# Altium project Library_Test.PrjPcb
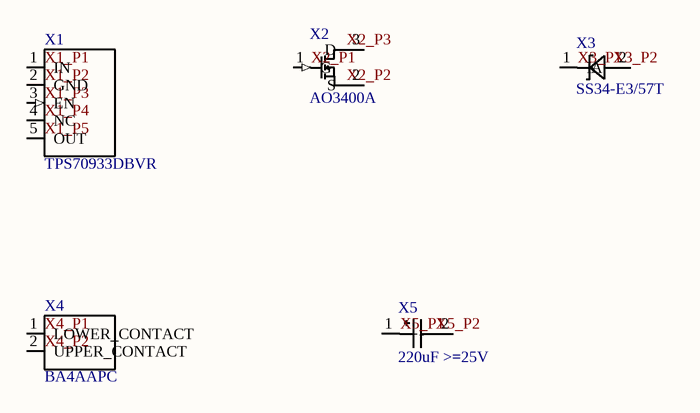
[diagram p0: Library_Test.SchDoc]
1 sheet, 5 parts. Net scope: global (net labels, ports and power ports of the same name join across sheets).

## Sheet Library_Test.SchDoc
size D

### Parts
X1  TPS70933DBVR  [TB_TPS709_DBV0005A]
X2  AO3400A  [TB_AOS_SOT23_PO00001M]
X3  SS34-E3/57T  [TB_VISHAY_SMC_SS34]
X4  BA4AAPC  [TB_MPD_BA4AAPC_REVH]
X5  220uF >=25V  [TB_CAP_RADIAL_D10_P5]

### Nets

Not connected (* = marked no-connect by the designer): X1 1(IN) 2(GND) 3(EN) 4(NC) 5(OUT); X2 1(G) 2(S) 3(D); X3 1(K) 2(A); X4 1(LOWER_CONTACT) 2(UPPER_CONTACT); X5 1(+) 2(-)

### Notes on the sheet
- Labels drawn without touching a wire or pin: X1_P1, X1_P2, X1_P3, X1_P4, X1_P5, X2_P1, X2_P2, X2_P3, X3_P1, X3_P2, X4_P1, X4_P2, X5_P1, X5_P2

### Library data of the parts
X1 = TPS70933DBVR: 3.3V 150mA 30V low-Iq LDO; DBV non-A/B pinout; Manufacturer: Texas Instruments; Do Not Substitute: Yes; Assembly Notes: EN may float for always-on; do not connect EN directly to 12V.; Sourcing Status: LCSC in stock verified 2026-11-11; recheck at order time; Verification Status: See validation report; Manufacturer Part Number: TPS70933DBVR; LCSC Part #: C89347; Source: TI TPS709 Rev H; DBV0005A drawing 4214839/K 08/2024
X2 = AO3400A: 30V N-channel MOSFET; G=1 S=2 D=3; Manufacturer: Alpha & Omega Semiconductor; Do Not Substitute: Yes; Assembly Notes: 48mOhm max at VGS=2.5V; verify motor stall current and PCB thermal design.; Sourcing Status: LCSC in stock verified 2026-11-11; recheck at order time; Verification Status: See validation report; Manufacturer Part Number: AO3400A; LCSC Part #: C20917; Source: AOS AO3400A Rev 3.1 July 2023; SOT23 PO-00001 version M
X3 = SS34-E3_57T: 40V 3A Schottky flyback diode; SMC DO-214AB; Manufacturer: Vishay General Semiconductor; Do Not Substitute: Yes; Assembly Notes: Pad 1 is cathode (band), connected to pump positive. Not an SMA footprint.; Sourcing Status: LCSC in stock verified 2026-11-11; recheck at order time; Verification Status: See validation report; Manufacturer Part Number: SS34-E3/57T; LCSC Part #: C13354; Source: Vishay document 88751 Rev 23-Apr-2020 page 3
X4 = BA4AAPC_LAYOUT_CHECK: 4xAA PCB holder; layout model; terminal polarity requires sample check; Manufacturer: Memory Protection Devices, Inc.; Do Not Substitute: Yes; Assembly Notes: PCB layout orientation and physical terminal polarity must be confirmed against a sample before fabrication. Pins deliberately NOT named +/-.; Sourcing Status: LCSC out of stock 2026-11-11; alternate source Digi-Key 2439225, availability recheck required; Verification Status: Layout only - polarity/sample check required; Manufacturer Part Number: BA4AAPC; LCSC Part #: C6748055; Source: MPD BA4AAPC drawing Rev H 03/06/19 PCB LAYOUT
X5 = C_RADIAL_D10_P5: Generic polarized radial capacitor; D<=10mm P=5mm H<=20mm; 220uF >=25V target; Do Not Substitute: No - envelope constrained; Assembly Notes: Source 220uF >=25V, 5mm lead spacing, <=10mm diameter, <=20mm height, leads <=0.6mm. Check leakage for battery life.; Sourcing Status: Lab sourced; verify body and pitch; Verification Status: See validation report; Source: User-selected lab sourcing envelope; custom radial land pattern, not manufacturer-specific